# Altium schematic sheet Top-Sheet.SchDoc
size 420 x 297 mm; SheetNumber: 1; SheetTotal: 15
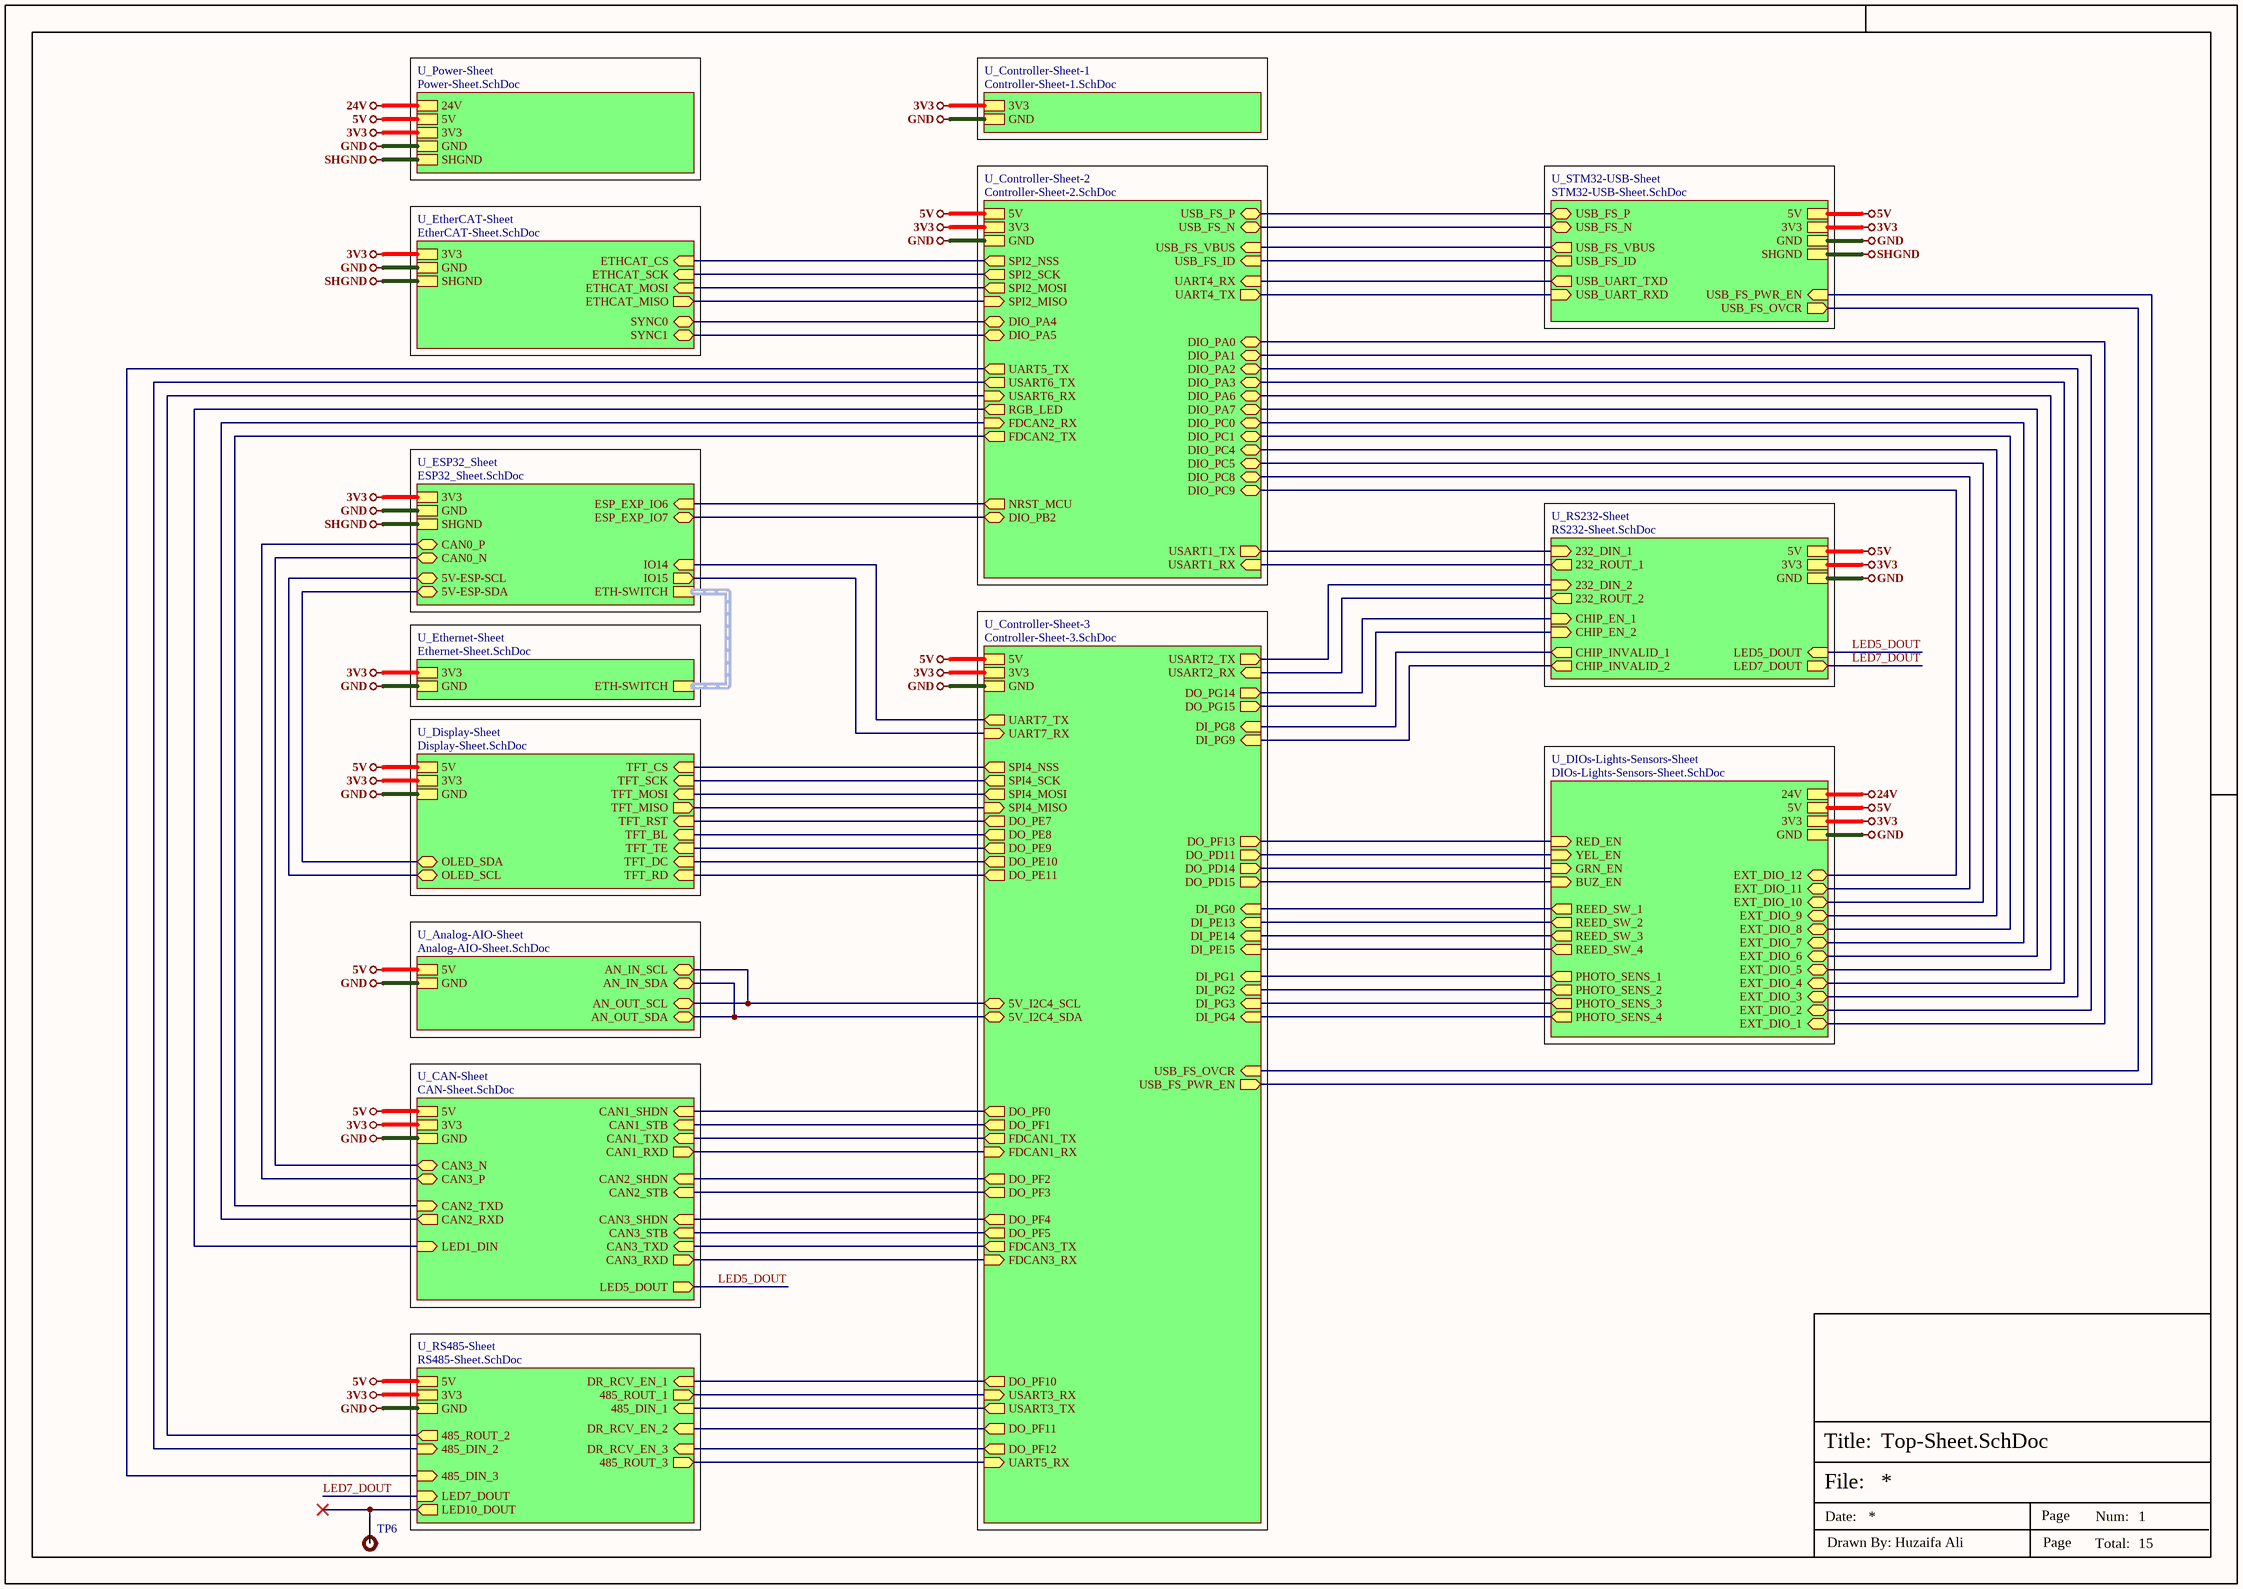
[diagram p0: Top-Sheet.SchDoc]

## Parts
TP6  TEST POINT 0.5mm Dia  [Test-point - 0.5mm]  (value not drawn)  (no BOM)

## Sub-sheets
U_Analog-AIO-Sheet = Analog-AIO-Sheet.SchDoc: GND, 5V, AN_IN_SCL (bidir), AN_IN_SDA (bidir), AN_OUT_SCL (bidir), AN_OUT_SDA (bidir)
U_CAN-Sheet = CAN-Sheet.SchDoc: GND, 3V3, 5V, CAN1_STB (in), CAN1_TXD (in), CAN1_RXD (out), CAN1_SHDN (in), CAN2_STB (in), CAN2_TXD (in), CAN2_RXD (out), CAN2_SHDN (in), CAN3_STB (in), CAN3_TXD (in), CAN3_RXD (out), CAN3_SHDN (in), LED1_DIN (in), LED5_DOUT (out), CAN3_P (bidir), CAN3_N (bidir)
U_Controller-Sheet-1 = Controller-Sheet-1.SchDoc: GND, 3V3
U_Controller-Sheet-2 = Controller-Sheet-2.SchDoc: GND, 3V3, 5V, DIO_PA1 (bidir), DIO_PA2 (bidir), DIO_PA7 (bidir), FDCAN2_RX (in), DIO_PC1 (bidir), DIO_PC4 (bidir), DIO_PC5 (bidir), USB_FS_VBUS (in), USB_FS_ID (in), USB_FS_N (bidir), USB_FS_P (bidir), USART6_TX (out), USART6_RX (in), UART4_TX (out), UART4_RX (in), UART5_TX (out), NRST_MCU (out), USART1_TX (out), USART1_RX (in), SPI2_SCK (out), SPI2_NSS (out), FDCAN2_TX (out), SPI2_MISO (in), SPI2_MOSI (out), DIO_PA0 (bidir), DIO_PA3 (bidir), DIO_PA4 (bidir), DIO_PA5 (bidir), DIO_PA6 (bidir), DIO_PB2 (bidir), RGB_LED (out), DIO_PC0 (bidir), DIO_PC8 (bidir), DIO_PC9 (bidir)
U_Controller-Sheet-3 = Controller-Sheet-3.SchDoc: GND, FDCAN1_RX (in), FDCAN1_TX (out), UART5_RX (in), USART2_TX (out), USART2_RX (in), USART3_TX (out), USART3_RX (in), USB_FS_PWR_EN (out), FDCAN3_RX (in), FDCAN3_TX (out), USB_FS_OVCR (in), DI_PE13 (in), DI_PE14 (in), DI_PE15 (in), DI_PG0 (in), DI_PG1 (in), DI_PG2 (in), DI_PG3 (in), DI_PG4 (in), DI_PG8 (in), DI_PG9 (in), SPI4_SCK (out), SPI4_NSS (out), SPI4_MISO (in), SPI4_MOSI (out), DO_PD11 (out), DO_PD14 (out), DO_PD15 (out), DO_PF0 (out), DO_PF1 (out), DO_PF2 (out), DO_PF3 (out), DO_PF4 (out), DO_PF5 (out), DO_PF10 (out), DO_PF11 (out), DO_PF12 (out), DO_PF13 (out), DO_PG14 (out), DO_PG15 (out), 5V_I2C4_SDA (bidir), 5V_I2C4_SCL (bidir), UART7_RX (in), UART7_TX (out), DO_PE7 (out), DO_PE8 (out), DO_PE9 (out), DO_PE10 (out), DO_PE11 (out), 3V3, 5V
U_DIOs-Lights-Sensors-Sheet = DIOs-Lights-Sensors-Sheet.SchDoc: GND, 3V3, 5V, 24V, BUZ_EN (in), GRN_EN (in), RED_EN (in), YEL_EN (in), REED_SW_3 (out), REED_SW_1 (out), REED_SW_4 (out), REED_SW_2 (out), PHOTO_SENS_3 (out), PHOTO_SENS_1 (out), PHOTO_SENS_4 (out), PHOTO_SENS_2 (out), EXT_DIO_1 (bidir), EXT_DIO_2 (bidir), EXT_DIO_3 (bidir), EXT_DIO_4 (bidir), EXT_DIO_5 (bidir), EXT_DIO_6 (bidir), EXT_DIO_7 (bidir), EXT_DIO_8 (bidir), EXT_DIO_9 (bidir), EXT_DIO_10 (bidir), EXT_DIO_11 (bidir), EXT_DIO_12 (bidir)
U_Display-Sheet = Display-Sheet.SchDoc: 3V3, GND, 5V, TFT_TE (in), TFT_DC (in), TFT_RD (in), TFT_RST (in), TFT_BL (in), TFT_SCK (in), TFT_CS (in), TFT_MOSI (in), TFT_MISO (out), OLED_SCL (bidir), OLED_SDA (bidir)
U_ESP32_Sheet = ESP32_Sheet.SchDoc: 3V3, GND, IO14 (in), IO15 (out), ESP_EXP_IO6 (in), ESP_EXP_IO7 (bidir), ETH-SWITCH (harness ETH-SWITCH), SHGND, CAN0_P (bidir), CAN0_N (bidir), 5V-ESP-SCL (bidir), 5V-ESP-SDA (bidir)
U_EtherCAT-Sheet = EtherCAT-Sheet.SchDoc: GND, 3V3, SHGND, ETHCAT_SCK (in), ETHCAT_CS (in), ETHCAT_MISO (out), ETHCAT_MOSI (in), SYNC1 (bidir), SYNC0 (bidir)
U_Ethernet-Sheet = Ethernet-Sheet.SchDoc: 3V3, GND, ETH-SWITCH (harness ETH-SWITCH)
U_Power-Sheet = Power-Sheet.SchDoc: GND, 3V3, 5V, 24V, SHGND
U_RS232-Sheet = RS232-Sheet.SchDoc: GND, 3V3, 5V, 232_DIN_1 (in), 232_ROUT_1 (out), CHIP_EN_1 (in), CHIP_INVALID_1 (out), 232_DIN_2 (in), 232_ROUT_2 (out), CHIP_EN_2 (in), CHIP_INVALID_2 (out), LED5_DOUT (in), LED7_DOUT (out)
U_RS485-Sheet = RS485-Sheet.SchDoc: GND, 3V3, 5V, DR_RCV_EN_1 (in), 485_ROUT_1 (out), 485_DIN_1 (in), DR_RCV_EN_2 (in), 485_ROUT_2 (out), 485_DIN_2 (in), DR_RCV_EN_3 (in), 485_ROUT_3 (out), 485_DIN_3 (in), LED7_DOUT (in), LED10_DOUT (out)
U_STM32-USB-Sheet = STM32-USB-Sheet.SchDoc: GND, 3V3, 5V, SHGND, USB_FS_PWR_EN (in), USB_FS_OVCR (out), USB_FS_VBUS (out), USB_FS_ID (out), USB_FS_N (bidir), USB_FS_P (bidir), USB_UART_RXD (in), USB_UART_TXD (out)

## Nets
3V3: sheet U_Power-Sheet/3V3, sheet U_ESP32_Sheet/3V3, sheet U_Ethernet-Sheet/3V3, sheet U_Display-Sheet/3V3, sheet U_Controller-Sheet-2/3V3, sheet U_CAN-Sheet/3V3, sheet U_DIOs-Lights-Sensors-Sheet/3V3, sheet U_Controller-Sheet-3/3V3, sheet U_EtherCAT-Sheet/3V3, sheet U_Controller-Sheet-1/3V3, sheet U_STM32-USB-Sheet/3V3, sheet U_RS485-Sheet/3V3, sheet U_RS232-Sheet/3V3
5V: sheet U_Power-Sheet/5V, sheet U_Display-Sheet/5V, sheet U_Controller-Sheet-2/5V, sheet U_CAN-Sheet/5V, sheet U_DIOs-Lights-Sensors-Sheet/5V, sheet U_Controller-Sheet-3/5V, sheet U_Analog-AIO-Sheet/5V, sheet U_STM32-USB-Sheet/5V, sheet U_RS485-Sheet/5V, sheet U_RS232-Sheet/5V
24V: sheet U_Power-Sheet/24V, sheet U_DIOs-Lights-Sensors-Sheet/24V
GND: sheet U_Power-Sheet/GND, sheet U_ESP32_Sheet/GND, sheet U_Ethernet-Sheet/GND, sheet U_Display-Sheet/GND, sheet U_Controller-Sheet-2/GND, sheet U_CAN-Sheet/GND, sheet U_DIOs-Lights-Sensors-Sheet/GND, sheet U_Controller-Sheet-3/GND, sheet U_Analog-AIO-Sheet/GND, sheet U_EtherCAT-Sheet/GND, sheet U_Controller-Sheet-1/GND, sheet U_STM32-USB-Sheet/GND, sheet U_RS485-Sheet/GND, sheet U_RS232-Sheet/GND
SHGND: sheet U_Power-Sheet/SHGND, sheet U_ESP32_Sheet/SHGND, sheet U_EtherCAT-Sheet/SHGND, sheet U_STM32-USB-Sheet/SHGND
LED5_DOUT: sheet U_CAN-Sheet/LED5_DOUT, sheet U_RS232-Sheet/LED5_DOUT
LED7_DOUT: sheet U_RS485-Sheet/LED7_DOUT, sheet U_RS232-Sheet/LED7_DOUT
NetTP6_1: TP6.1 ; sheet U_RS485-Sheet/LED10_DOUT
(unnamed): sheet U_ESP32_Sheet/IO14, sheet U_Controller-Sheet-3/UART7_TX
(unnamed): sheet U_ESP32_Sheet/IO15, sheet U_Controller-Sheet-3/UART7_RX
(unnamed): sheet U_ESP32_Sheet/ESP_EXP_IO6, sheet U_Controller-Sheet-2/NRST_MCU
(unnamed): sheet U_ESP32_Sheet/ESP_EXP_IO7, sheet U_Controller-Sheet-2/DIO_PB2
(unnamed): sheet U_ESP32_Sheet/CAN0_P, sheet U_CAN-Sheet/CAN3_P
(unnamed): sheet U_ESP32_Sheet/CAN0_N, sheet U_CAN-Sheet/CAN3_N
(unnamed): sheet U_ESP32_Sheet/5V-ESP-SCL, sheet U_Display-Sheet/OLED_SCL
(unnamed): sheet U_ESP32_Sheet/5V-ESP-SDA, sheet U_Display-Sheet/OLED_SDA
(unnamed): sheet U_Display-Sheet/TFT_TE, sheet U_Controller-Sheet-3/DO_PE9
(unnamed): sheet U_Display-Sheet/TFT_DC, sheet U_Controller-Sheet-3/DO_PE10
(unnamed): sheet U_Display-Sheet/TFT_RD, sheet U_Controller-Sheet-3/DO_PE11
(unnamed): sheet U_Display-Sheet/TFT_RST, sheet U_Controller-Sheet-3/DO_PE7
(unnamed): sheet U_Display-Sheet/TFT_BL, sheet U_Controller-Sheet-3/DO_PE8
(unnamed): sheet U_Display-Sheet/TFT_SCK, sheet U_Controller-Sheet-3/SPI4_SCK
(unnamed): sheet U_Display-Sheet/TFT_CS, sheet U_Controller-Sheet-3/SPI4_NSS
(unnamed): sheet U_Display-Sheet/TFT_MOSI, sheet U_Controller-Sheet-3/SPI4_MOSI
(unnamed): sheet U_Display-Sheet/TFT_MISO, sheet U_Controller-Sheet-3/SPI4_MISO
(unnamed): sheet U_Controller-Sheet-2/DIO_PA1, sheet U_DIOs-Lights-Sensors-Sheet/EXT_DIO_2
(unnamed): sheet U_Controller-Sheet-2/DIO_PA2, sheet U_DIOs-Lights-Sensors-Sheet/EXT_DIO_3
(unnamed): sheet U_Controller-Sheet-2/DIO_PA7, sheet U_DIOs-Lights-Sensors-Sheet/EXT_DIO_6
(unnamed): sheet U_Controller-Sheet-2/FDCAN2_RX, sheet U_CAN-Sheet/CAN2_RXD
(unnamed): sheet U_Controller-Sheet-2/DIO_PC1, sheet U_DIOs-Lights-Sensors-Sheet/EXT_DIO_8
(unnamed): sheet U_Controller-Sheet-2/DIO_PC4, sheet U_DIOs-Lights-Sensors-Sheet/EXT_DIO_9
(unnamed): sheet U_Controller-Sheet-2/DIO_PC5, sheet U_DIOs-Lights-Sensors-Sheet/EXT_DIO_10
(unnamed): sheet U_Controller-Sheet-2/USB_FS_VBUS, sheet U_STM32-USB-Sheet/USB_FS_VBUS
(unnamed): sheet U_Controller-Sheet-2/USB_FS_ID, sheet U_STM32-USB-Sheet/USB_FS_ID
(unnamed): sheet U_Controller-Sheet-2/USB_FS_N, sheet U_STM32-USB-Sheet/USB_FS_N
(unnamed): sheet U_Controller-Sheet-2/USB_FS_P, sheet U_STM32-USB-Sheet/USB_FS_P
(unnamed): sheet U_Controller-Sheet-2/USART6_TX, sheet U_RS485-Sheet/485_DIN_2
(unnamed): sheet U_Controller-Sheet-2/USART6_RX, sheet U_RS485-Sheet/485_ROUT_2
(unnamed): sheet U_Controller-Sheet-2/UART4_TX, sheet U_STM32-USB-Sheet/USB_UART_RXD
(unnamed): sheet U_Controller-Sheet-2/UART4_RX, sheet U_STM32-USB-Sheet/USB_UART_TXD
(unnamed): sheet U_Controller-Sheet-2/UART5_TX, sheet U_RS485-Sheet/485_DIN_3
(unnamed): sheet U_Controller-Sheet-2/USART1_TX, sheet U_RS232-Sheet/232_DIN_1
(unnamed): sheet U_Controller-Sheet-2/USART1_RX, sheet U_RS232-Sheet/232_ROUT_1
(unnamed): sheet U_Controller-Sheet-2/SPI2_SCK, sheet U_EtherCAT-Sheet/ETHCAT_SCK
(unnamed): sheet U_Controller-Sheet-2/SPI2_NSS, sheet U_EtherCAT-Sheet/ETHCAT_CS
(unnamed): sheet U_Controller-Sheet-2/FDCAN2_TX, sheet U_CAN-Sheet/CAN2_TXD
(unnamed): sheet U_Controller-Sheet-2/SPI2_MISO, sheet U_EtherCAT-Sheet/ETHCAT_MISO
(unnamed): sheet U_Controller-Sheet-2/SPI2_MOSI, sheet U_EtherCAT-Sheet/ETHCAT_MOSI
(unnamed): sheet U_Controller-Sheet-2/DIO_PA0, sheet U_DIOs-Lights-Sensors-Sheet/EXT_DIO_1
(unnamed): sheet U_Controller-Sheet-2/DIO_PA3, sheet U_DIOs-Lights-Sensors-Sheet/EXT_DIO_4
(unnamed): sheet U_Controller-Sheet-2/DIO_PA4, sheet U_EtherCAT-Sheet/SYNC0
(unnamed): sheet U_Controller-Sheet-2/DIO_PA5, sheet U_EtherCAT-Sheet/SYNC1
(unnamed): sheet U_Controller-Sheet-2/DIO_PA6, sheet U_DIOs-Lights-Sensors-Sheet/EXT_DIO_5
(unnamed): sheet U_Controller-Sheet-2/RGB_LED, sheet U_CAN-Sheet/LED1_DIN
(unnamed): sheet U_Controller-Sheet-2/DIO_PC0, sheet U_DIOs-Lights-Sensors-Sheet/EXT_DIO_7
(unnamed): sheet U_Controller-Sheet-2/DIO_PC8, sheet U_DIOs-Lights-Sensors-Sheet/EXT_DIO_11
(unnamed): sheet U_Controller-Sheet-2/DIO_PC9, sheet U_DIOs-Lights-Sensors-Sheet/EXT_DIO_12
(unnamed): sheet U_CAN-Sheet/CAN1_STB, sheet U_Controller-Sheet-3/DO_PF1
(unnamed): sheet U_CAN-Sheet/CAN1_TXD, sheet U_Controller-Sheet-3/FDCAN1_TX
(unnamed): sheet U_CAN-Sheet/CAN1_RXD, sheet U_Controller-Sheet-3/FDCAN1_RX
(unnamed): sheet U_CAN-Sheet/CAN1_SHDN, sheet U_Controller-Sheet-3/DO_PF0
(unnamed): sheet U_CAN-Sheet/CAN2_STB, sheet U_Controller-Sheet-3/DO_PF3
(unnamed): sheet U_CAN-Sheet/CAN2_SHDN, sheet U_Controller-Sheet-3/DO_PF2
(unnamed): sheet U_CAN-Sheet/CAN3_STB, sheet U_Controller-Sheet-3/DO_PF5
(unnamed): sheet U_CAN-Sheet/CAN3_TXD, sheet U_Controller-Sheet-3/FDCAN3_TX
(unnamed): sheet U_CAN-Sheet/CAN3_RXD, sheet U_Controller-Sheet-3/FDCAN3_RX
(unnamed): sheet U_CAN-Sheet/CAN3_SHDN, sheet U_Controller-Sheet-3/DO_PF4
(unnamed): sheet U_DIOs-Lights-Sensors-Sheet/BUZ_EN, sheet U_Controller-Sheet-3/DO_PD15
(unnamed): sheet U_DIOs-Lights-Sensors-Sheet/GRN_EN, sheet U_Controller-Sheet-3/DO_PD14
(unnamed): sheet U_DIOs-Lights-Sensors-Sheet/RED_EN, sheet U_Controller-Sheet-3/DO_PF13
(unnamed): sheet U_DIOs-Lights-Sensors-Sheet/YEL_EN, sheet U_Controller-Sheet-3/DO_PD11
(unnamed): sheet U_DIOs-Lights-Sensors-Sheet/REED_SW_3, sheet U_Controller-Sheet-3/DI_PE14
(unnamed): sheet U_DIOs-Lights-Sensors-Sheet/REED_SW_1, sheet U_Controller-Sheet-3/DI_PG0
(unnamed): sheet U_DIOs-Lights-Sensors-Sheet/REED_SW_4, sheet U_Controller-Sheet-3/DI_PE15
(unnamed): sheet U_DIOs-Lights-Sensors-Sheet/REED_SW_2, sheet U_Controller-Sheet-3/DI_PE13
(unnamed): sheet U_DIOs-Lights-Sensors-Sheet/PHOTO_SENS_3, sheet U_Controller-Sheet-3/DI_PG3
(unnamed): sheet U_DIOs-Lights-Sensors-Sheet/PHOTO_SENS_1, sheet U_Controller-Sheet-3/DI_PG1
(unnamed): sheet U_DIOs-Lights-Sensors-Sheet/PHOTO_SENS_4, sheet U_Controller-Sheet-3/DI_PG4
(unnamed): sheet U_DIOs-Lights-Sensors-Sheet/PHOTO_SENS_2, sheet U_Controller-Sheet-3/DI_PG2
(unnamed): sheet U_Controller-Sheet-3/UART5_RX, sheet U_RS485-Sheet/485_ROUT_3
(unnamed): sheet U_Controller-Sheet-3/USART2_TX, sheet U_RS232-Sheet/232_DIN_2
(unnamed): sheet U_Controller-Sheet-3/USART2_RX, sheet U_RS232-Sheet/232_ROUT_2
(unnamed): sheet U_Controller-Sheet-3/USART3_TX, sheet U_RS485-Sheet/485_DIN_1
(unnamed): sheet U_Controller-Sheet-3/USART3_RX, sheet U_RS485-Sheet/485_ROUT_1
(unnamed): sheet U_Controller-Sheet-3/USB_FS_PWR_EN, sheet U_STM32-USB-Sheet/USB_FS_PWR_EN
(unnamed): sheet U_Controller-Sheet-3/USB_FS_OVCR, sheet U_STM32-USB-Sheet/USB_FS_OVCR
(unnamed): sheet U_Controller-Sheet-3/DI_PG8, sheet U_RS232-Sheet/CHIP_INVALID_1
(unnamed): sheet U_Controller-Sheet-3/DI_PG9, sheet U_RS232-Sheet/CHIP_INVALID_2
(unnamed): sheet U_Controller-Sheet-3/DO_PF10, sheet U_RS485-Sheet/DR_RCV_EN_1
(unnamed): sheet U_Controller-Sheet-3/DO_PF11, sheet U_RS485-Sheet/DR_RCV_EN_2
(unnamed): sheet U_Controller-Sheet-3/DO_PF12, sheet U_RS485-Sheet/DR_RCV_EN_3
(unnamed): sheet U_Controller-Sheet-3/DO_PG14, sheet U_RS232-Sheet/CHIP_EN_1
(unnamed): sheet U_Controller-Sheet-3/DO_PG15, sheet U_RS232-Sheet/CHIP_EN_2
(unnamed): sheet U_Controller-Sheet-3/5V_I2C4_SDA, sheet U_Analog-AIO-Sheet/AN_IN_SDA, sheet U_Analog-AIO-Sheet/AN_OUT_SDA
(unnamed): sheet U_Controller-Sheet-3/5V_I2C4_SCL, sheet U_Analog-AIO-Sheet/AN_IN_SCL, sheet U_Analog-AIO-Sheet/AN_OUT_SCL

## Buses and harness runs
harness sheet U_ESP32_Sheet/ETH-SWITCH = sheet U_Ethernet-Sheet/ETH-SWITCH

## Notes on the sheet
- File:
- Title:
- Date:
- Page
- Num:
- Total:
- Drawn By: Huzaifa Ali

## Library data of the parts
TP6 = TEST POINT 0.5mm Dia: Test Point ON; Item Type: Test Point; Manufacturer Part Number: TEST POINT 0.5mm Dia